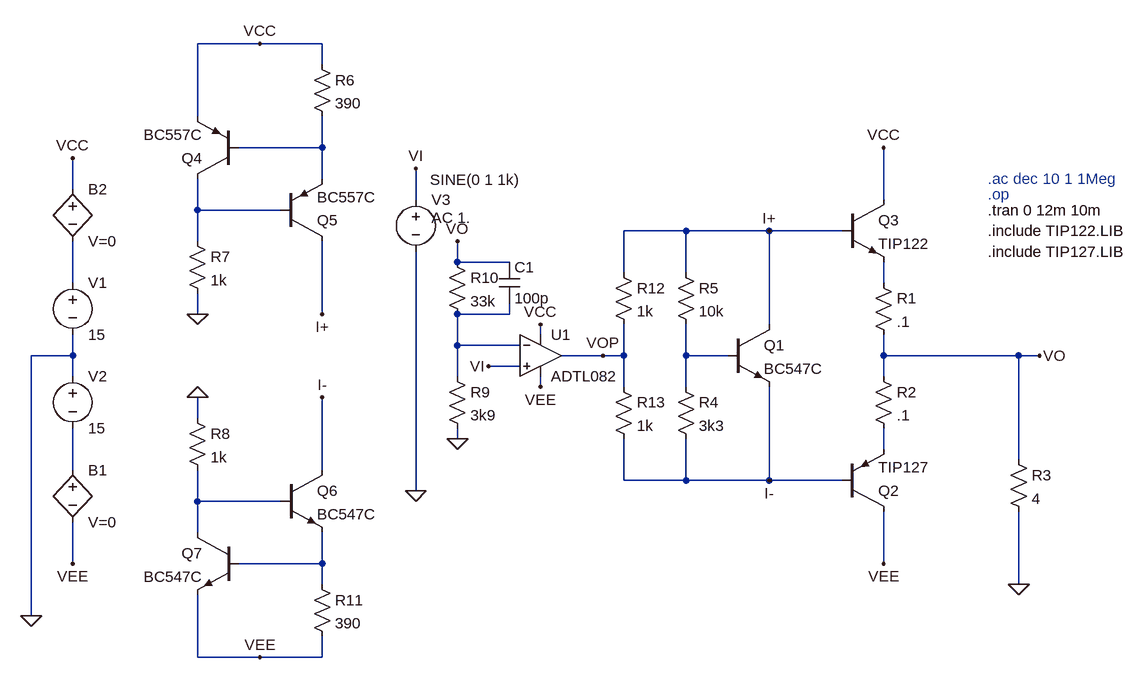
[diagram p0: schematic ampli.asc]
ampli.asc, the LTspice schematic file:
Version 4.1
SHEET 1 1440 1176
WIRE -640 -176 -736 -176
WIRE -544 -176 -640 -176
WIRE -544 -144 -544 -176
WIRE -736 -64 -736 -176
WIRE -544 -16 -544 -64
WIRE -544 -16 -672 -16
WIRE -544 32 -544 -16
WIRE -928 48 -928 0
WIRE -400 64 -400 16
WIRE 320 64 320 -16
WIRE -736 80 -736 32
WIRE -608 80 -736 80
WIRE 16 112 -80 112
WIRE 144 112 16 112
WIRE 256 112 144 112
WIRE -736 128 -736 80
WIRE -336 160 -336 128
WIRE -256 160 -336 160
WIRE -80 176 -80 112
WIRE 16 176 16 112
WIRE -928 192 -928 128
WIRE 320 192 320 160
WIRE -736 240 -736 208
WIRE -544 240 -544 128
WIRE -256 240 -256 224
WIRE -256 240 -336 240
WIRE 144 256 144 112
WIRE -208 272 -208 256
WIRE -336 288 -336 240
WIRE -240 288 -336 288
WIRE -928 304 -928 272
WIRE -928 304 -992 304
WIRE -112 304 -176 304
WIRE -80 304 -80 256
WIRE -80 304 -112 304
WIRE 16 304 16 256
WIRE 80 304 16 304
WIRE 320 304 320 272
WIRE 528 304 320 304
WIRE 560 304 528 304
WIRE -240 320 -288 320
WIRE -928 336 -928 304
WIRE -336 336 -336 288
WIRE 320 336 320 304
WIRE -208 352 -208 336
WIRE -80 352 -80 304
WIRE 16 352 16 304
WIRE -736 400 -736 368
WIRE -336 432 -336 416
WIRE 320 448 320 416
WIRE 528 464 528 304
WIRE -928 480 -928 416
WIRE -544 480 -544 368
WIRE -80 496 -80 432
WIRE 16 496 16 432
WIRE 16 496 -80 496
WIRE 144 496 144 352
WIRE 144 496 16 496
WIRE 256 496 144 496
WIRE -400 512 -400 144
WIRE -736 528 -736 480
WIRE -608 528 -736 528
WIRE -736 576 -736 528
WIRE -928 624 -928 560
WIRE -544 624 -544 576
WIRE -544 624 -672 624
WIRE 320 624 320 544
WIRE -544 656 -544 624
WIRE 528 656 528 544
WIRE -992 704 -992 304
WIRE -736 768 -736 672
WIRE -640 768 -736 768
WIRE -544 768 -544 736
WIRE -544 768 -640 768
FLAG 528 656 0
FLAG -928 0 VCC
FLAG -928 624 VEE
FLAG -992 704 0
FLAG -400 512 0
FLAG -400 16 VI
FLAG 320 -16 VCC
FLAG 320 624 VEE
FLAG 560 304 VO
FLAG -208 352 VEE
FLAG -208 256 VCC
FLAG -288 320 VI
FLAG -336 128 VO
FLAG -336 432 0
FLAG -640 -176 VCC
FLAG -736 240 0
FLAG -544 240 I+
FLAG 144 112 I+
FLAG 144 496 I-
FLAG -736 368 0
FLAG -640 768 VEE
FLAG -544 368 I-
FLAG -112 304 VOP
DATAFLAG 64 112 ""
DATAFLAG 64 496 ""
SYMBOL res 304 176 R0
SYMATTR InstName R1
SYMATTR Value .1
SYMBOL res 304 320 R0
SYMATTR InstName R2
SYMATTR Value .1
SYMBOL res 512 448 R0
SYMATTR InstName R3
SYMATTR Value 4
SYMBOL voltage -928 176 R0
WINDOW 123 0 0 Left 0
WINDOW 39 0 0 Left 0
SYMATTR InstName V1
SYMATTR Value 15
SYMBOL voltage -928 320 R0
WINDOW 123 0 0 Left 0
WINDOW 39 0 0 Left 0
SYMATTR InstName V2
SYMATTR Value 15
SYMBOL bv -928 464 R0
SYMATTR InstName B1
SYMATTR Value V=0
SYMBOL bv -928 32 R0
SYMATTR InstName B2
SYMATTR Value V=0
SYMBOL voltage -400 48 R0
WINDOW 3 22 -15 Left 2
WINDOW 123 24 44 Left 2
WINDOW 39 0 0 Left 0
SYMATTR Value SINE(0 1 1k)
SYMATTR Value2 AC 1.
SYMATTR InstName V3
SYMBOL npn 80 256 R0
SYMATTR InstName Q1
SYMATTR Value BC547C
SYMBOL res 0 336 R0
SYMATTR InstName R4
SYMATTR Value 3k3
SYMBOL res 0 160 R0
SYMATTR InstName R5
SYMATTR Value 10k
SYMBOL pnp 256 544 M180
SYMATTR InstName Q2
SYMATTR Value TIP127
SYMATTR Prefix XP
SYMBOL npn 256 64 R0
SYMATTR InstName Q3
SYMATTR Value TIP122
SYMATTR Prefix XN
SYMBOL OpAmps\\ADTL082 -208 240 R0
SYMATTR InstName U1
SYMBOL res -352 320 R0
SYMATTR InstName R9
SYMATTR Value 3k9
SYMBOL res -352 144 R0
SYMATTR InstName R10
SYMATTR Value 33k
SYMBOL pnp -608 128 M180
SYMATTR InstName Q5
SYMATTR Value BC557C
SYMBOL pnp -672 32 R180
SYMATTR InstName Q4
SYMATTR Value BC557C
SYMBOL res -560 -160 R0
SYMATTR InstName R6
SYMATTR Value 390
SYMBOL res -752 112 R0
SYMATTR InstName R7
SYMATTR Value 1k
SYMBOL res -752 384 R0
SYMATTR InstName R8
SYMATTR Value 1k
SYMBOL npn -608 480 R0
SYMATTR InstName Q6
SYMATTR Value BC547C
SYMBOL npn -672 576 M0
SYMATTR InstName Q7
SYMATTR Value BC547C
SYMBOL res -560 640 R0
SYMATTR InstName R11
SYMATTR Value 390
SYMBOL res -96 160 R0
SYMATTR InstName R12
SYMATTR Value 1k
SYMBOL res -96 336 R0
SYMATTR InstName R13
SYMATTR Value 1k
SYMBOL cap -272 160 R0
SYMATTR InstName C1
SYMATTR Value 100p
TEXT 480 112 Left 2 !.include TIP122.LIB
TEXT 480 144 Left 2 !.include TIP127.LIB
TEXT 480 80 Left 2 !.tran 0 12m 10m
TEXT 480 56 Left 2 ;.op
TEXT 480 32 Left 2 ;.ac dec 10 1 1Meg

The netlist it stands for:
* ampli.asc
R1 N004 VO .1
R2 VO N007 .1
R3 VO 0 4
V1 N003 0 15
V2 0 N008 15
B1 N008 VEE V=0
B2 VCC N003 V=0
V3 VI 0 SINE(0 1 1k) AC 1.
Q1 I+ N006 I- 0 BC547C
R4 N006 I- 3k3
R5 I+ N006 10k
X§Q2 VEE I- N007 TIP127  ; pins C B E
X§Q3 VCC I+ N004 TIP122  ; pins C B E
X§U1 VI N005 VCC VEE VOP ADTL082  ; pins In+ In- V+ V- OUT
R9 N005 0 3k9
R10 VO N005 33k
Q5 I+ N002 N001 0 BC557C
Q4 N002 N001 VCC 0 BC557C
R6 VCC N001 390
R7 N002 0 1k
R8 0 N009 1k
Q6 I- N009 N010 0 BC547C
Q7 N009 N010 VEE 0 BC547C
R11 N010 VEE 390
R12 I+ VOP 1k
R13 VOP I- 1k
C1 VO N005 100p
.model NPN NPN
.model PNP PNP
.lib standard.bjt
.include TIP122.LIB
.include TIP127.LIB
.tran 0 12m 10m
* .op
* .ac dec 10 1 1Meg
.lib ADI.lib
.backanno
.end